# Altium project Controller_board.PrjPcb
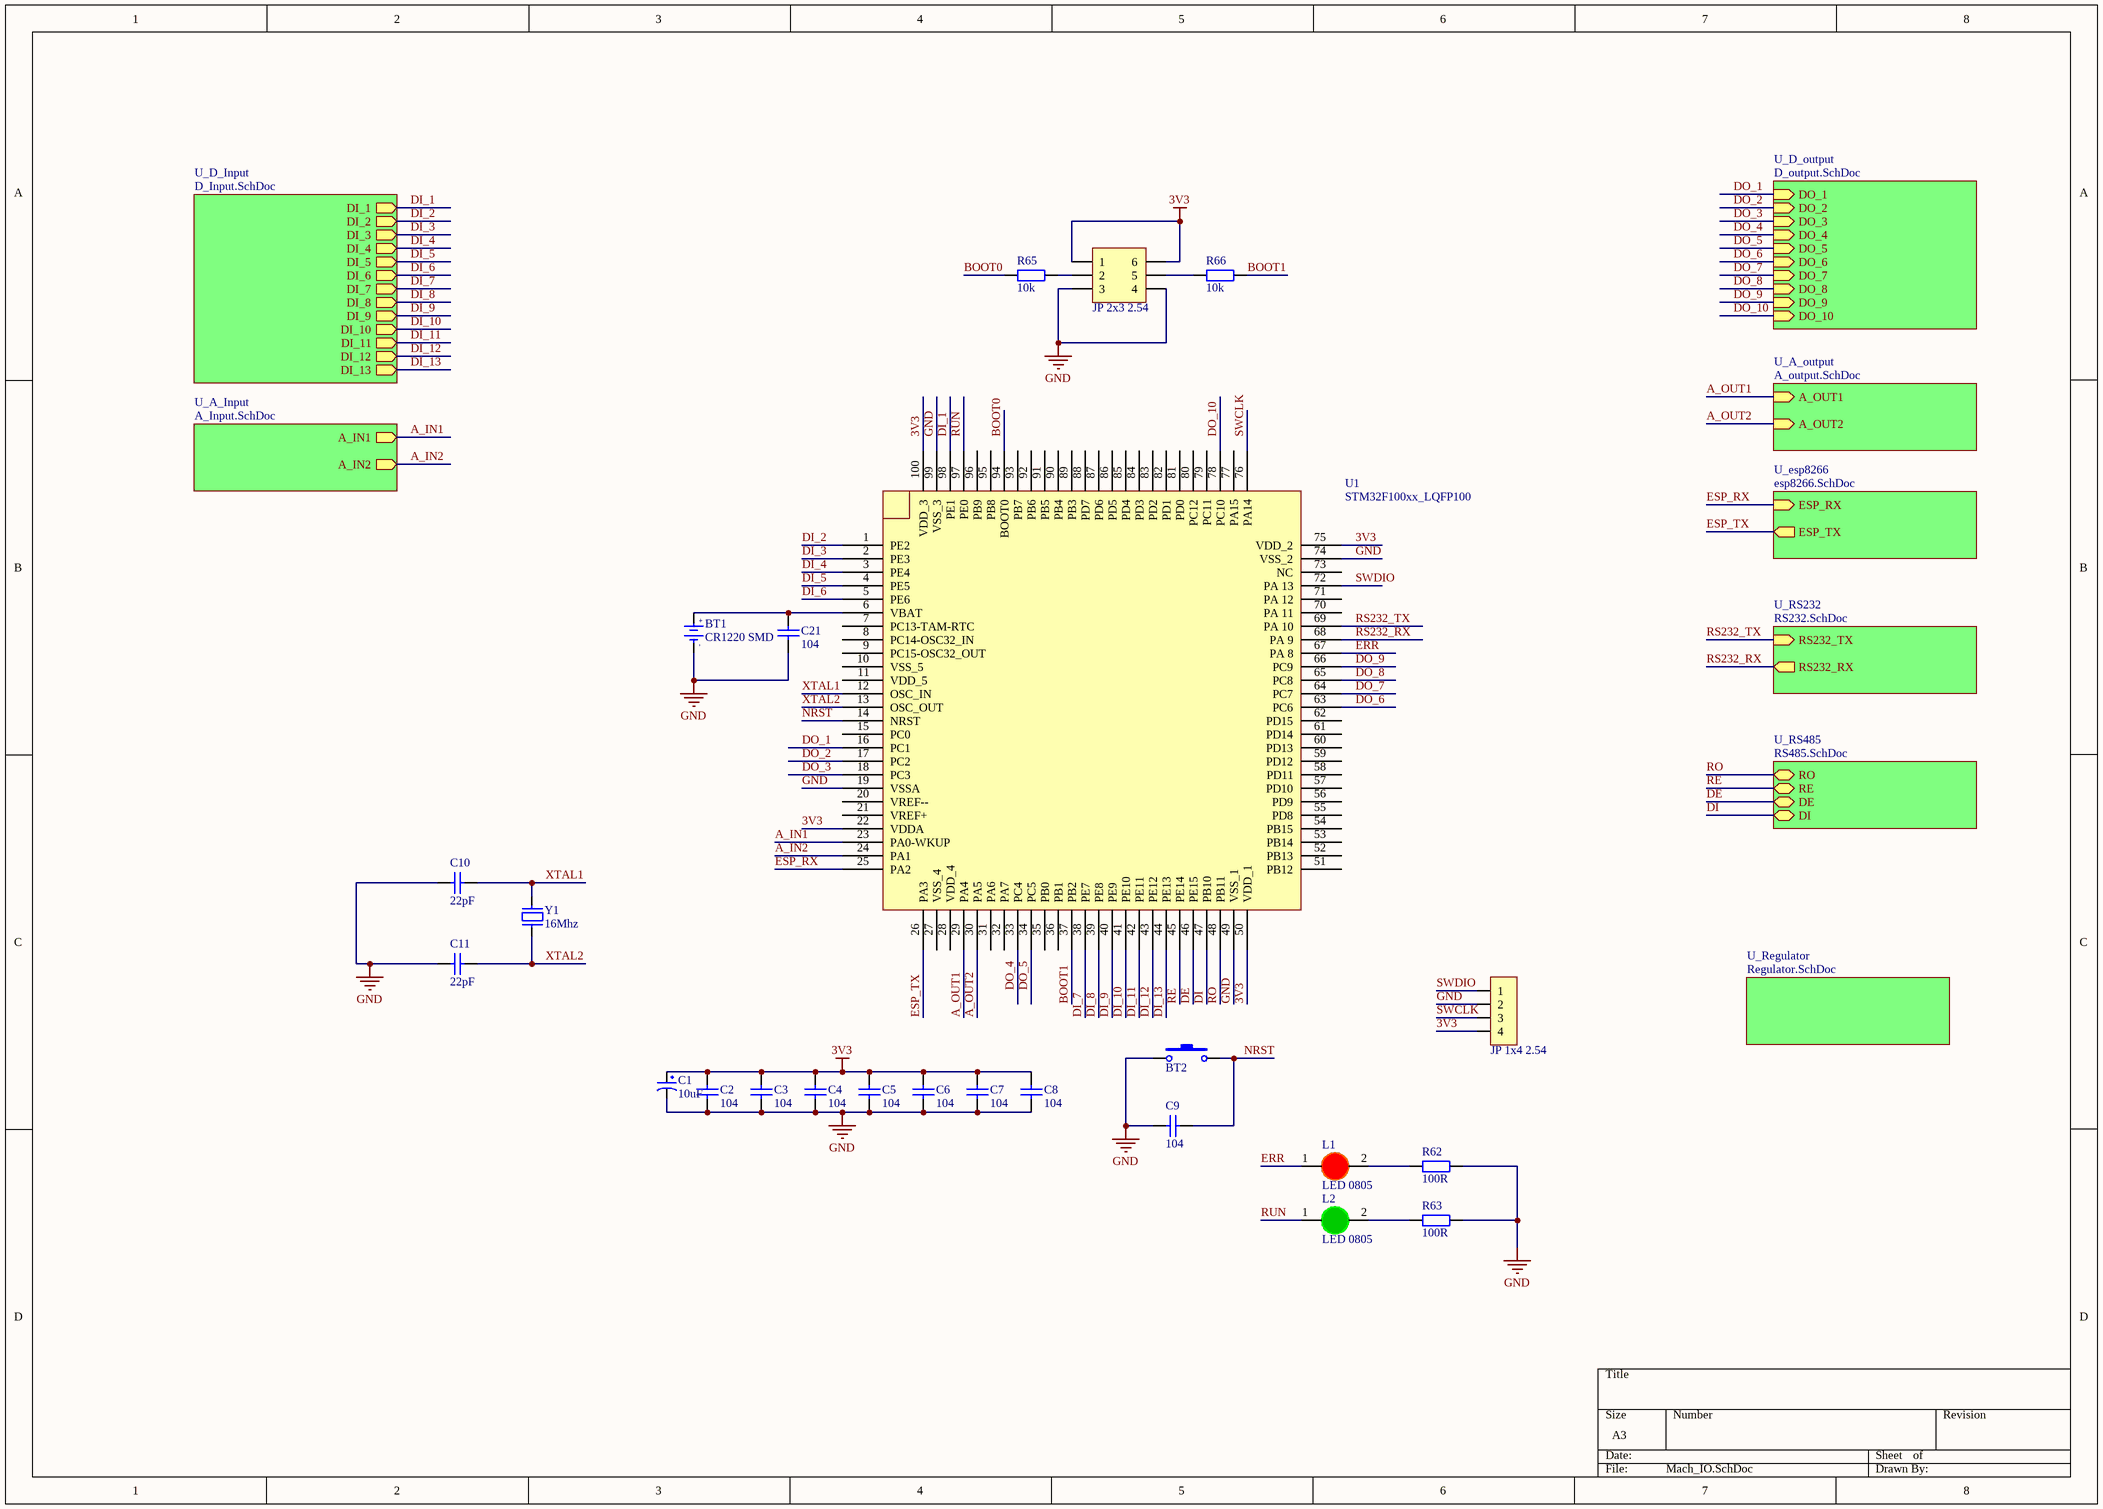
[diagram p0: Mach_IO.SchDoc]
9 sheets, 150 parts. Net scope: hierarchical (ports join the sheet entries above them; power ports are global).
Board file: Mach_IO.PcbDoc
Sheets:
  Mach_IO.SchDoc
    U_D_Input = D_Input.SchDoc
    U_D_output = D_output.SchDoc
    U_RS232 = RS232.SchDoc
    U_RS485 = RS485.SchDoc
    U_esp8266 = esp8266.SchDoc
    U_A_Input = A_Input.SchDoc
    U_A_output = A_output.SchDoc
    U_Regulator = Regulator.SchDoc

## Sheet Mach_IO.SchDoc
size A3; SheetNumber: 1; SheetTotal: 9

### Parts
BT1  CR1220 SMD  [DE PIN CR1220]
BT2  Nut Nhan 2 Chan SMD 3x6x2.5  [Nut Nhan 2 Chan SMD 3x6x2.5]  (value not drawn)
C1  10uF  [tu tantalum smd3216]
C2  104  [tu 0805]
C3  104  [tu 0805]
C4  104  [tu 0805]
C5  104  [tu 0805]
C6  104  [tu 0805]
C7  104  [tu 0805]
C8  104  [tu 0805]
C9  104  [tu 0805]
C10  22pF  [tu 0805]
C11  22pF  [tu 0805]
C21  104  [tu 0805]
JP2  JP 2x3 2.54  [JP 2x3 DT]
JP10  JP 1x4 2.54  [JP 1x4 DT]
L1  LED 0805  [LED-0805-Red]
L2  LED 0805  [LED-0805-Green]
R62  100R  [tro smd 0805]
R63  100R  [tro smd 0805]
R65  10k  [tro smd 0805]
R66  10k  [tro smd 0805]
U1  STM32F100xx_LQFP100  [STM32_LQFP100]
Y1  16Mhz  [Thach Anh 2 chan cam]

### Sub-sheets
U_A_Input = A_Input.SchDoc: A_IN1 (out), A_IN2 (out)
U_A_output = A_output.SchDoc: A_OUT1 (in), A_OUT2 (in)
U_D_Input = D_Input.SchDoc: DI_1 (out), DI_2 (out), DI_3 (out), DI_4 (out), DI_5 (out), DI_6 (out), DI_7 (out), DI_8 (out), DI_9 (out), DI_10 (out), DI_11 (out), DI_12 (out), DI_13 (out)
U_D_output = D_output.SchDoc: DO_1 (in), DO_2 (in), DO_3 (in), DO_4 (in), DO_5 (in), DO_6 (in), DO_7 (in), DO_8 (in), DO_9 (in), DO_10 (in)
U_esp8266 = esp8266.SchDoc: ESP_TX (out), ESP_RX (in)
U_Regulator = Regulator.SchDoc: no entries
U_RS232 = RS232.SchDoc: RS232_RX (out), RS232_TX (in)
U_RS485 = RS485.SchDoc: RO (bidir), RE (bidir), DE (bidir), DI (bidir)

### Nets
3V3: C1.1 C2.1 C3.1 C4.1 C5.1 C6.1 C7.1 C8.1 JP2.1 JP2.6 JP10.4 U1.22(VDDA) U1.50(VDD_1) U1.75(VDD_2) U1.100(VDD_3)
GND: BT1.2(GND) BT2.1 C1.2 C2.2 C3.2 C4.2 C5.2 C6.2 C7.2 C8.2 C9.1 C10.2 C11.2 C21.1 JP2.3 JP2.4 JP10.2 R62.2 R63.2 U1.19(VSSA) U1.49(VSS_1) U1.74(VSS_2) U1.99(VSS_3)
A_IN1: U1.23(PA0-WKUP) ; sheet U_A_Input/A_IN1
A_IN2: U1.24(PA1) ; sheet U_A_Input/A_IN2
A_OUT1: U1.29(PA4) ; sheet U_A_output/A_OUT1
A_OUT2: U1.30(PA5) ; sheet U_A_output/A_OUT2
BOOT0: R65.1 U1.94(BOOT0)
BOOT1: R66.2 U1.37(PB2)
DE: U1.46(PE15) ; sheet U_RS485/DE
DI: U1.47(PB10) ; sheet U_RS485/DI
DI_1: U1.98(PE1) ; sheet U_D_Input/DI_1
DI_2: U1.1(PE2) ; sheet U_D_Input/DI_2
DI_3: U1.2(PE3) ; sheet U_D_Input/DI_3
DI_4: U1.3(PE4) ; sheet U_D_Input/DI_4
DI_5: U1.4(PE5) ; sheet U_D_Input/DI_5
DI_6: U1.5(PE6) ; sheet U_D_Input/DI_6
DI_7: U1.38(PE7) ; sheet U_D_Input/DI_7
DI_8: U1.39(PE8) ; sheet U_D_Input/DI_8
DI_9: U1.40(PE9) ; sheet U_D_Input/DI_9
DI_10: U1.41(PE10) ; sheet U_D_Input/DI_10
DI_11: U1.42(PE11) ; sheet U_D_Input/DI_11
DI_12: U1.43(PE12) ; sheet U_D_Input/DI_12
DI_13: U1.44(PE13) ; sheet U_D_Input/DI_13
DO_1: U1.16(PC1) ; sheet U_D_output/DO_1
DO_2: U1.17(PC2) ; sheet U_D_output/DO_2
DO_3: U1.18(PC3) ; sheet U_D_output/DO_3
DO_4: U1.33(PC4) ; sheet U_D_output/DO_4
DO_5: U1.34(PC5) ; sheet U_D_output/DO_5
DO_6: U1.63(PC6) ; sheet U_D_output/DO_6
DO_7: U1.64(PC7) ; sheet U_D_output/DO_7
DO_8: U1.65(PC8) ; sheet U_D_output/DO_8
DO_9: U1.66(PC9) ; sheet U_D_output/DO_9
DO_10: U1.78(PC10) ; sheet U_D_output/DO_10
ERR: L1.1(A) U1.67(PA_8)
ESP_RX: U1.25(PA2) ; sheet U_esp8266/ESP_RX
ESP_TX: U1.26(PA3) ; sheet U_esp8266/ESP_TX
NRST: BT2.2 C9.2 U1.14(NRST)
RE: U1.45(PE14) ; sheet U_RS485/RE
RO: U1.48(PB11) ; sheet U_RS485/RO
RS232_RX: U1.68(PA_9) ; sheet U_RS232/RS232_RX
RS232_TX: U1.69(PA_10) ; sheet U_RS232/RS232_TX
RUN: L2.1(A) U1.97(PE0)
SWCLK: JP10.3 U1.76(PA14)
SWDIO: JP10.1 U1.72(PA_13)
XTAL1: C10.1 U1.12(OSC_IN) Y1.2
XTAL2: C11.1 U1.13(OSC_OUT) Y1.1
NetBT1_1: BT1.1(+3V) C21.2 U1.6(VBAT)
NetJP2_2: JP2.2 R65.2
NetJP2_5: JP2.5 R66.1
NetL1_2: L1.2(K) R62.1
NetL2_2: L2.2(K) R63.1

Not connected (* = marked no-connect by the designer): U1 7(PC13-TAM-RTC) 8(PC14-OSC32_IN) 9(PC15-OSC32_OUT) 10(VSS_5) 11(VDD_5) 15(PC0) 20(VREF--) 21(VREF+) 27(VSS_4) 28(VDD_4) 31(PA6) 32(PA7) 35(PB0) 36(PB1) 51(PB12) 52(PB13) 53(PB14) 54(PB15) 55(PD8) 56(PD9) 57(PD10) 58(PD11) 59(PD12) 60(PD13) 61(PD14) 62(PD15) 70(PA_11) 71(PA_12) 73(NC) 77(PA15) 79(PC11) 80(PC12) 81(PD0) 82(PD1) 83(PD2) 84(PD3) 85(PD4) 86(PD5) 87(PD6) 88(PD7) 89(PB3) 90(PB4) 91(PB5) 92(PB6) 93(PB7) 95(PB8) 96(PB9)

### Notes on the sheet
- (in symbol De pin CR1220 SMD) +; -

### Library data of the parts
BT1 = De pin CR1220 SMD: Ten: Đế PIN CR1220 SMD; Ma_Hang: MH000833
BT2 = Nut Nhan 2 Chan SMD 3x6x2.5: Ma_Hang: MH001036; Ten: Nút Nhấn 2 Chân 3x6x2.5MM SMD
C1 = Tu tantalum 10uF 16V SMD3216: Dán; Don_Vi: Con; So_Chan: 2; Ten_Linh_Kien: Tụ tantalum 106C-10uF 16V SMD3216; Ma_Hang: MH001954; Chung_Loai: Dán; Kieu_Chan: *
C2-C9 C21 = Tu 0805 104 50V 10%: Dán; Don_Vi: Con; So_Chan: 2; Ten_Linh_Kien: Tụ 0805 104-100nF 10% 50V; Ma_Hang: MH004551; Chung_Loai: Dán; Kieu_Chan: *
C10 C11 = Tu 0805 22pF 50V 10%: Dán; Don_Vi: Con; So_Chan: 2; Ten_Linh_Kien: Tụ 0805 22P 10% 50V; Ma_Hang: MH004560; Chung_Loai: Dán; Kieu_Chan: *
JP2 = JP 2x3 2.54 Duc Thang: Cắm; Ten_Linh_Kien: Jump Đôi Đực 2.54MM 2x40P Thẳng 11MM; Don_Vi: Con; Ma_Hang: MH002686; Ghi_Chu: *; Kieu_Chan: *; Chung_Loai: Cắm
JP10 = JP 1x4 2.54 Duc Thang: Cắm; Ten_Linh_Kien: Jump Đơn Đực 2.54MM 1x40P Thẳng 11MM; Don_Vi: Con; Ma_Hang: MH000903; Ghi_Chu: *; Kieu_Chan: *; Chung_Loai: Cắm
L1 = LED 0805 Do: Dán; Don_Vi: Con; Ma_Hang: MH000897; Ten_Linh_Kien: LED 0805 Màu Đỏ (Red); Ghi_Chu: *; Kieu_Chan: *; Chung_Loai: Dán
L2 = LED 0805 Xanh La: Dán; Don_Vi: Con; Ma_Hang: MH002326; Ten_Linh_Kien: LED 0805 Màu Xanh Lá (Green); Ghi_Chu: *; Kieu_Chan: *; Chung_Loai: Dán
R62 R63 = Tro 0805 5% 100R: Dán; Don_Vi: Con; So_Chan: 2; Ten_Linh_Kien: Trở 0805 5% 100R; Ma_Hang: MH005251; Chung_Loai: Dán; Kieu_Chan: *
R65 R66 = Tro 0805 1% 10k: Dán; Don_Vi: Con; So_Chan: 2; Ten_Linh_Kien: Trở 0805 1% 10k; Ma_Hang: MH005473; Chung_Loai: Dán; Kieu_Chan: *
Y1 = Thach Anh 2 chan Cam: Crystal For all Crystal 2pin.; Value: 4Mhz

## Sheet D_Input.SchDoc
size A; SheetNumber: 2; SheetTotal: 9
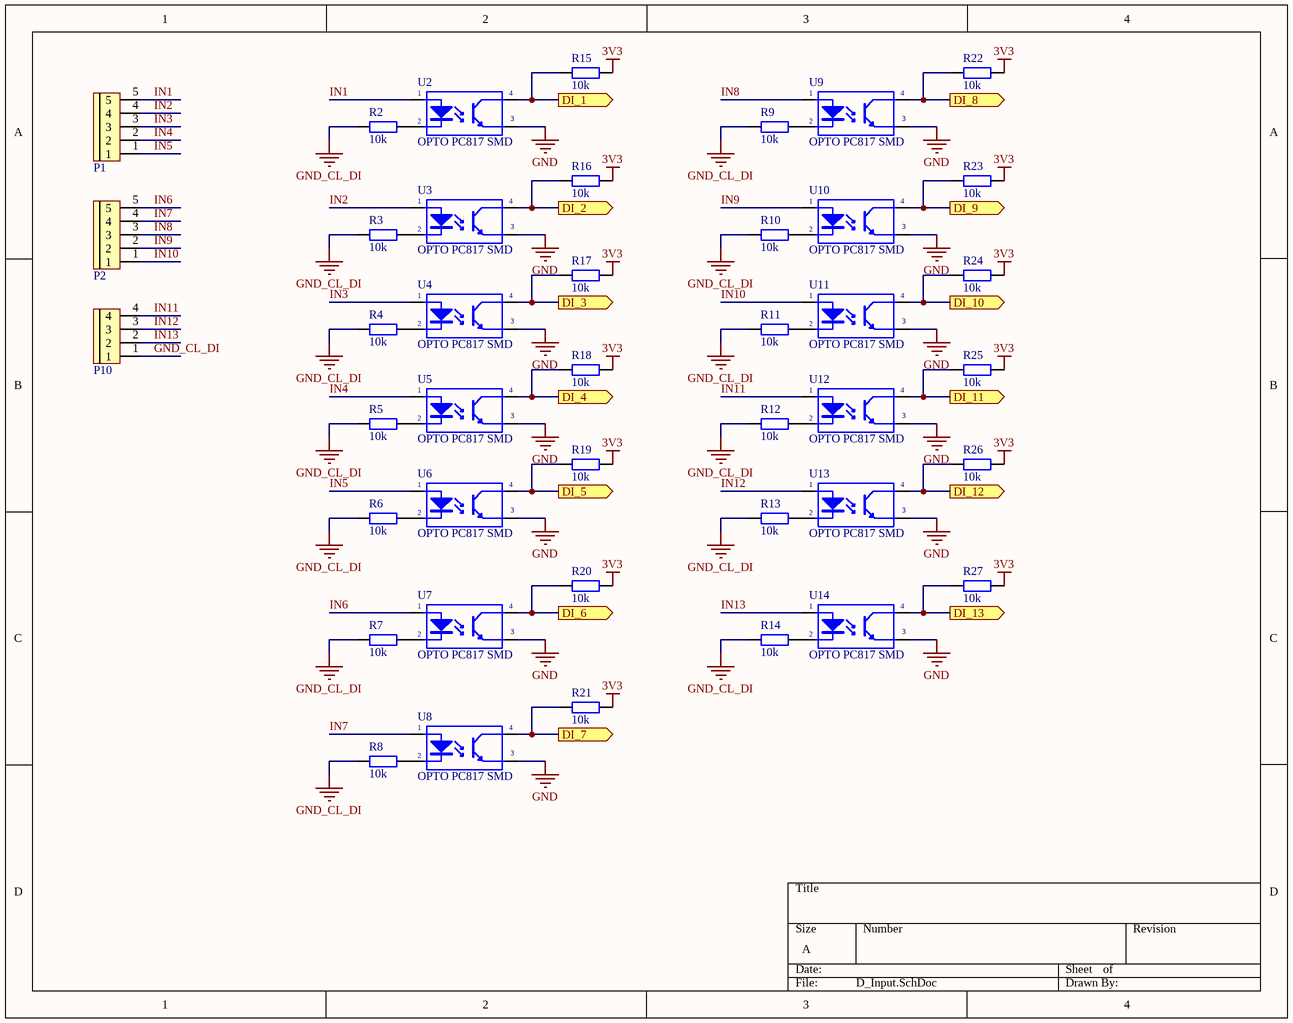
[diagram p1: D_Input.SchDoc]

### Parts
P1  CON 5 EDG5.08  [CON 5 5EDG5.08]  (value not drawn)
P2  CON 5 EDG5.08  [CON 5 5EDG5.08]  (value not drawn)
P10  CON 4 EDG5.08  [CON 4 4EDG5.08]  (value not drawn)
R2  10k  [tro smd 0805]
R3  10k  [tro smd 0805]
R4  10k  [tro smd 0805]
R5  10k  [tro smd 0805]
R6  10k  [tro smd 0805]
R7  10k  [tro smd 0805]
R8  10k  [tro smd 0805]
R9  10k  [tro smd 0805]
R10  10k  [tro smd 0805]
R11  10k  [tro smd 0805]
R12  10k  [tro smd 0805]
R13  10k  [tro smd 0805]
R14  10k  [tro smd 0805]
R15  10k  [tro smd 0805]
R16  10k  [tro smd 0805]
R17  10k  [tro smd 0805]
R18  10k  [tro smd 0805]
R19  10k  [tro smd 0805]
R20  10k  [tro smd 0805]
R21  10k  [tro smd 0805]
R22  10k  [tro smd 0805]
R23  10k  [tro smd 0805]
R24  10k  [tro smd 0805]
R25  10k  [tro smd 0805]
R26  10k  [tro smd 0805]
R27  10k  [tro smd 0805]
U2  OPTO PC817 SMD  [SOP4]
U3  OPTO PC817 SMD  [SOP4]
U4  OPTO PC817 SMD  [SOP4]
U5  OPTO PC817 SMD  [SOP4]
U6  OPTO PC817 SMD  [SOP4]
U7  OPTO PC817 SMD  [SOP4]
U8  OPTO PC817 SMD  [SOP4]
U9  OPTO PC817 SMD  [SOP4]
U10  OPTO PC817 SMD  [SOP4]
U11  OPTO PC817 SMD  [SOP4]
U12  OPTO PC817 SMD  [SOP4]
U13  OPTO PC817 SMD  [SOP4]
U14  OPTO PC817 SMD  [SOP4]

### Ports
DI_1 (out), DI_2 (out), DI_3 (out), DI_4 (out), DI_5 (out), DI_6 (out), DI_7 (out), DI_8 (out), DI_9 (out), DI_10 (out), DI_11 (out), DI_12 (out), DI_13 (out)

### Nets
3V3: R15.2 R16.2 R17.2 R18.2 R19.2 R20.2 R21.2 R22.2 R23.2 R24.2 R25.2 R26.2 R27.2
GND: U2.3(E) U3.3(E) U4.3(E) U5.3(E) U6.3(E) U7.3(E) U8.3(E) U9.3(E) U10.3(E) U11.3(E) U12.3(E) U13.3(E) U14.3(E)
GND_CL_DI: P10.1 R2.2 R3.2 R4.2 R5.2 R6.2 R7.2 R8.2 R9.2 R10.2 R11.2 R12.2 R13.2 R14.2
DI_1: R15.1 U2.4(C) ; port DI_1
DI_2: R16.1 U3.4(C) ; port DI_2
DI_3: R17.1 U4.4(C) ; port DI_3
DI_4: R18.1 U5.4(C) ; port DI_4
DI_5: R19.1 U6.4(C) ; port DI_5
DI_6: R20.1 U7.4(C) ; port DI_6
DI_7: R21.1 U8.4(C) ; port DI_7
DI_8: R22.1 U9.4(C) ; port DI_8
DI_9: R23.1 U10.4(C) ; port DI_9
DI_10: R24.1 U11.4(C) ; port DI_10
DI_11: R25.1 U12.4(C) ; port DI_11
DI_12: R26.1 U13.4(C) ; port DI_12
DI_13: R27.1 U14.4(C) ; port DI_13
IN1: P1.5 U2.1(A)
IN2: P1.4 U3.1(A)
IN3: P1.3 U4.1(A)
IN4: P1.2 U5.1(A)
IN5: P1.1 U6.1(A)
IN6: P2.5 U7.1(A)
IN7: P2.4 U8.1(A)
IN8: P2.3 U9.1(A)
IN9: P2.2 U10.1(A)
IN10: P2.1 U11.1(A)
IN11: P10.4 U12.1(A)
IN12: P10.3 U13.1(A)
IN13: P10.2 U14.1(A)
NetR2_1: R2.1 U2.2(K)
NetR3_1: R3.1 U3.2(K)
NetR4_1: R4.1 U4.2(K)
NetR5_1: R5.1 U5.2(K)
NetR6_1: R6.1 U6.2(K)
NetR7_1: R7.1 U7.2(K)
NetR8_1: R8.1 U8.2(K)
NetR9_1: R9.1 U9.2(K)
NetR10_1: R10.1 U10.2(K)
NetR11_1: R11.1 U11.2(K)
NetR12_1: R12.1 U12.2(K)
NetR13_1: R13.1 U13.2(K)
NetR14_1: R14.1 U14.2(K)

### Library data of the parts
P1 P2 = CON 5 EDG5.08: Cắm; Ten_Linh_Kien: CON 5 2EDG5.08-5P 5.08MM ( Xanh Cong); Ma_Hang: MH003589; Kieu_Chan: *; Don_Vi: Con; Ghi_Chu: *; Chung_Loai: Cắm
P10 = CON 4 EDG5.08: Cắm; Ten_Linh_Kien: CON 4 2EDG5.08-4P 5.08MM ( Xanh Cong); Ma_Hang: MH000979; Don_Vi: Con; Ghi_Chu: *; Kieu_Chan: *; Chung_Loai: Cắm
R2-R27 = Tro 0805 1% 10k: as R65 on sheet Mach_IO; Chung_Loai: Dán; Kieu_Chan: *
U2-U14 = OPTO PC817 SMD: Single Opto; Value: PC817

## Sheet D_output.SchDoc
size A; SheetNumber: 3; SheetTotal: 9
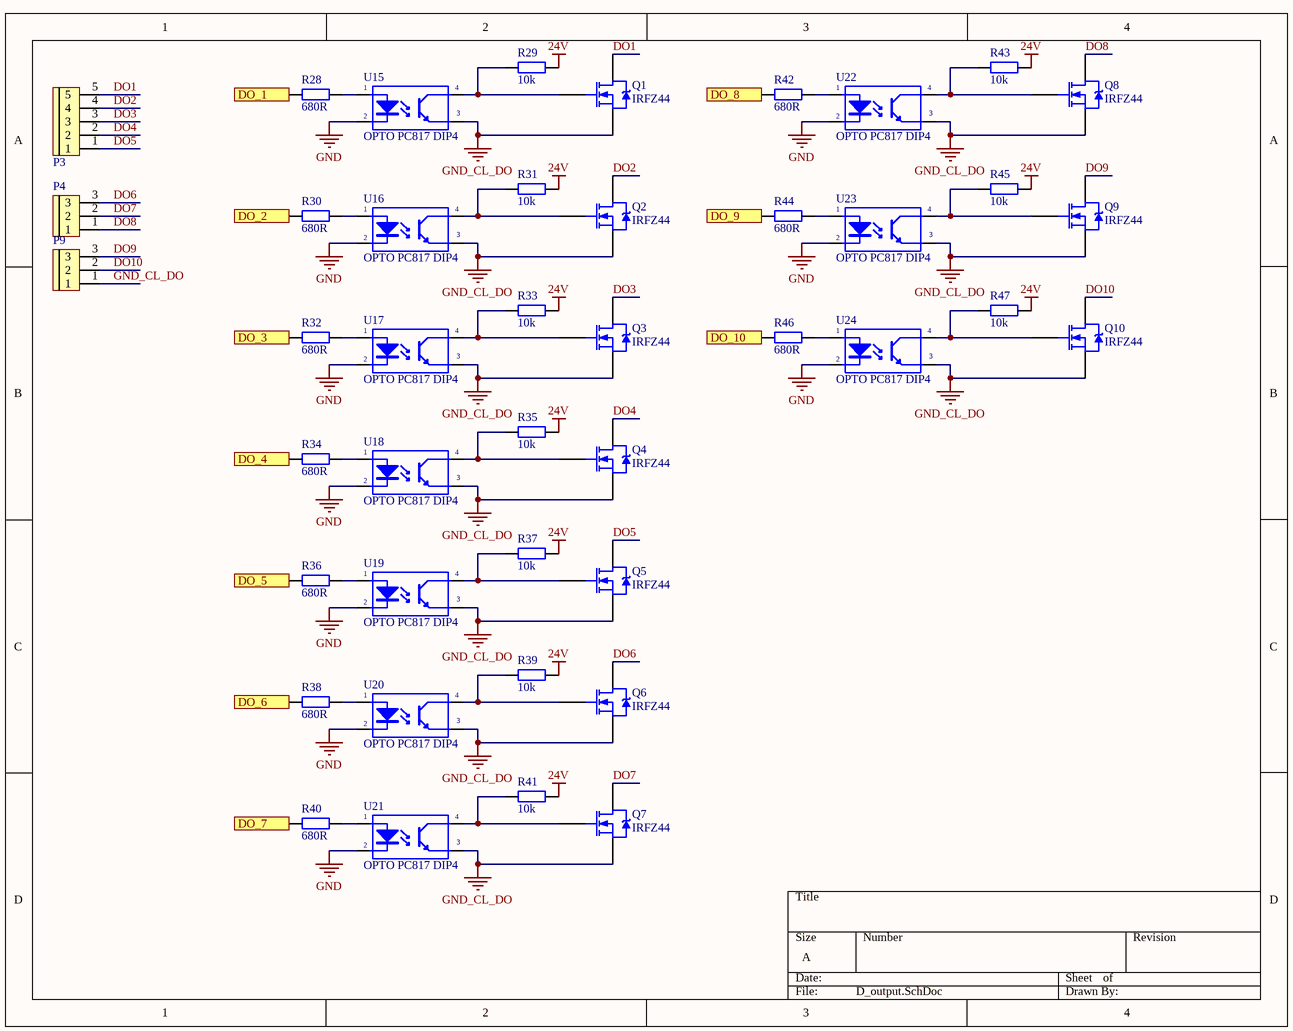
[diagram p2: D_output.SchDoc]

### Parts
P3  CON 5 EDG5.08  [CON 5 5EDG5.08]  (value not drawn)
P4  CON 3 EDG5.08  [CON 3 3EDG5.08]  (value not drawn)
P9  CON 3 EDG5.08  [CON 3 3EDG5.08]  (value not drawn)
Q1  IRFZ44  [TO220]
Q2  IRFZ44  [TO220]
Q3  IRFZ44  [TO220]
Q4  IRFZ44  [TO220]
Q5  IRFZ44  [TO220]
Q6  IRFZ44  [TO220]
Q7  IRFZ44  [TO220]
Q8  IRFZ44  [TO220]
Q9  IRFZ44  [TO220]
Q10  IRFZ44  [TO220]
R28  680R  [tro smd 0805]
R29  10k  [tro smd 0805]
R30  680R  [tro smd 0805]
R31  10k  [tro smd 0805]
R32  680R  [tro smd 0805]
R33  10k  [tro smd 0805]
R34  680R  [tro smd 0805]
R35  10k  [tro smd 0805]
R36  680R  [tro smd 0805]
R37  10k  [tro smd 0805]
R38  680R  [tro smd 0805]
R39  10k  [tro smd 0805]
R40  680R  [tro smd 0805]
R41  10k  [tro smd 0805]
R42  680R  [tro smd 0805]
R43  10k  [tro smd 0805]
R44  680R  [tro smd 0805]
R45  10k  [tro smd 0805]
R46  680R  [tro smd 0805]
R47  10k  [tro smd 0805]
U15  OPTO PC817 DIP4  [DIP4]
U16  OPTO PC817 DIP4  [DIP4]
U17  OPTO PC817 DIP4  [DIP4]
U18  OPTO PC817 DIP4  [DIP4]
U19  OPTO PC817 DIP4  [DIP4]
U20  OPTO PC817 DIP4  [DIP4]
U21  OPTO PC817 DIP4  [DIP4]
U22  OPTO PC817 DIP4  [DIP4]
U23  OPTO PC817 DIP4  [DIP4]
U24  OPTO PC817 DIP4  [DIP4]

### Ports
DO_1 (in), DO_2 (in), DO_3 (in), DO_4 (in), DO_5 (in), DO_6 (in), DO_7 (in), DO_8 (in), DO_9 (in), DO_10 (in)

### Nets
24V: R29.2 R31.2 R33.2 R35.2 R37.2 R39.2 R41.2 R43.2 R45.2 R47.2
GND: U15.2(K) U16.2(K) U17.2(K) U18.2(K) U19.2(K) U20.2(K) U21.2(K) U22.2(K) U23.2(K) U24.2(K)
GND_CL_DO: P9.1 Q1.3(S) Q2.3(S) Q3.3(S) Q4.3(S) Q5.3(S) Q6.3(S) Q7.3(S) Q8.3(S) Q9.3(S) Q10.3(S) U15.3(E) U16.3(E) U17.3(E) U18.3(E) U19.3(E) U20.3(E) U21.3(E) U22.3(E) U23.3(E) U24.3(E)
DO1: P3.5 Q1.2(D)
DO2: P3.4 Q2.2(D)
DO3: P3.3 Q3.2(D)
DO4: P3.2 Q4.2(D)
DO5: P3.1 Q5.2(D)
DO6: P4.3 Q6.2(D)
DO7: P4.2 Q7.2(D)
DO8: P4.1 Q8.2(D)
DO9: P9.3 Q9.2(D)
DO10: P9.2 Q10.2(D)
DO_1: R28.2 ; port DO_1
DO_2: R30.2 ; port DO_2
DO_3: R32.2 ; port DO_3
DO_4: R34.2 ; port DO_4
DO_5: R36.2 ; port DO_5
DO_6: R38.2 ; port DO_6
DO_7: R40.2 ; port DO_7
DO_8: R42.2 ; port DO_8
DO_9: R44.2 ; port DO_9
DO_10: R46.2 ; port DO_10
NetQ1_1: Q1.1(G) R29.1 U15.4(C)
NetQ2_1: Q2.1(G) R31.1 U16.4(C)
NetQ3_1: Q3.1(G) R33.1 U17.4(C)
NetQ4_1: Q4.1(G) R35.1 U18.4(C)
NetQ5_1: Q5.1(G) R37.1 U19.4(C)
NetQ6_1: Q6.1(G) R39.1 U20.4(C)
NetQ7_1: Q7.1(G) R41.1 U21.4(C)
NetQ8_1: Q8.1(G) R43.1 U22.4(C)
NetQ9_1: Q9.1(G) R45.1 U23.4(C)
NetQ10_1: Q10.1(G) R47.1 U24.4(C)
NetR28_1: R28.1 U15.1(A)
NetR30_1: R30.1 U16.1(A)
NetR32_1: R32.1 U17.1(A)
NetR34_1: R34.1 U18.1(A)
NetR36_1: R36.1 U19.1(A)
NetR38_1: R38.1 U20.1(A)
NetR40_1: R40.1 U21.1(A)
NetR42_1: R42.1 U22.1(A)
NetR44_1: R44.1 U23.1(A)
NetR46_1: R46.1 U24.1(A)

### Library data of the parts
P3 = CON 5 EDG5.08: as P1 on sheet D_Input; Kieu_Chan: *; Don_Vi: Con; Ghi_Chu: *; Chung_Loai: Cắm
P4 P9 = CON 3 EDG5.08: Cắm; Ten_Linh_Kien: CON 3 2EDG5.08-3P 5.08MM ( Xanh Cong); Ma_Hang: MH000760; Ghi_Chu: *; Kieu_Chan: *; Don_Vi: Con; Chung_Loai: Cắm
Q1-Q10 = FET IRFZ44 DIP: TO-220
R28-R47 = Tro 0805 1% 10k: as R65 on sheet Mach_IO; Chung_Loai: Dán; Kieu_Chan: *
U15-U24 = OPTO PC817 DIP4: Single Opto; Value: PC817

## Sheet RS232.SchDoc
size A; SheetNumber: 4; SheetTotal: 9
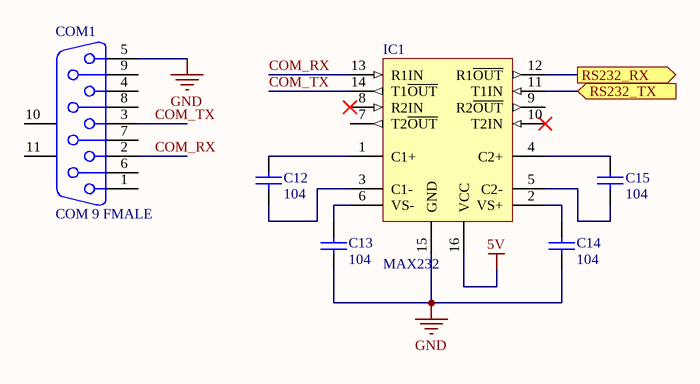
[diagram p3: RS232.SchDoc]

### Parts
C12  104  [tu 0805]
C13  104  [tu 0805]
C14  104  [tu 0805]
C15  104  [tu 0805]
COM1  COM 9 FMALE  [DSB 9-F]
IC1  MAX232  [DIP16/W0.3]

### Ports
RS232_RX (out), RS232_TX (in)

### Nets
5V: IC1.16(VCC)
GND: C13.1 C14.2 COM1.5 IC1.15(GND)
COM_RX: COM1.2 IC1.13(R1IN)
COM_TX: COM1.3 IC1.14(T1~{OUT})
RS232_RX: IC1.12(R1~{OUT}) ; port RS232_RX
RS232_TX: IC1.11(T1IN) ; port RS232_TX
NetC12_1: C12.1 IC1.1(C1+)
NetC12_2: C12.2 IC1.3(C1-)
NetC13_2: C13.2 IC1.6(VS-)
NetC14_1: C14.1 IC1.2(VS+)
NetC15_1: C15.1 IC1.4(C2+)
NetC15_2: C15.2 IC1.5(C2-)

Not connected (* = marked no-connect by the designer): COM1 1 4 6 7 8 9 10(MH1) 11(MH2); IC1 7(T2~{OUT}) 8(R2IN)* 9(R2~{OUT}) 10(T2IN)*

### Library data of the parts
C12-C15 = Tu 0805 104 50V 10%: as C2 on sheet Mach_IO; Chung_Loai: Dán; Kieu_Chan: *
COM1 = DSB9F: COM 9; PackageDocument: O; Positions: 9; Gender: Receptacle; Value: COM 9; Published: 15-Jun-2001; LatestRevisionDate: 17-Jul-2002; LatestRevisionNote: Re-released for DXP Platform.; DatasheetDocument: 1-Sep-1999; PackageReference: 788750; Publisher: Altium Limited; Orientation: Right Angle
IC1 = MAX232: Dual EIA-232 Driver/Receiver; Value: MAX232

## Sheet RS485.SchDoc
size A; SheetNumber: 5; SheetTotal: 9
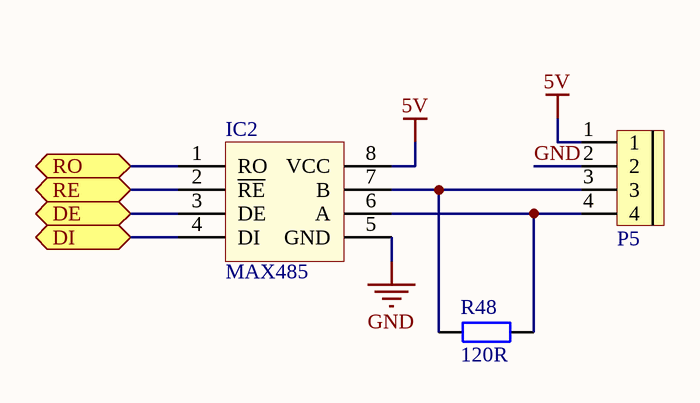
[diagram p4: RS485.SchDoc]

### Parts
IC2  MAX485  [DIP8/W0.3]
P5  CON 4 EDG5.08  [CON 4 4EDG5.08]  (value not drawn)
R48  120R  [tro smd 0805]

### Ports
DE (bidir), DI (bidir), RE (bidir), RO (bidir)

### Nets
5V: IC2.8(VCC) P5.1
GND: IC2.5(GND) P5.2
DE: IC2.3(DE) ; port DE
DI: IC2.4(DI) ; port DI
RE: IC2.2(~{RE}) ; port RE
RO: IC2.1(RO) ; port RO
NetIC2_6: IC2.6(A) P5.4 R48.2
NetIC2_7: IC2.7(B) P5.3 R48.1

### Library data of the parts
IC2 = MAX485: RS232 - RS485 (Same sn75176)
P5 = CON 4 EDG5.08: as P10 on sheet D_Input; Don_Vi: Con; Ghi_Chu: *; Kieu_Chan: *; Chung_Loai: Cắm
R48 = Tro 0805 5% 120R: Dán; Don_Vi: Con; So_Chan: 2; Ten_Linh_Kien: Trở 0805 5% 120R; Ma_Hang: MH005253; Chung_Loai: Dán; Kieu_Chan: *

## Sheet esp8266.SchDoc
size A; SheetNumber: 6; SheetTotal: 9
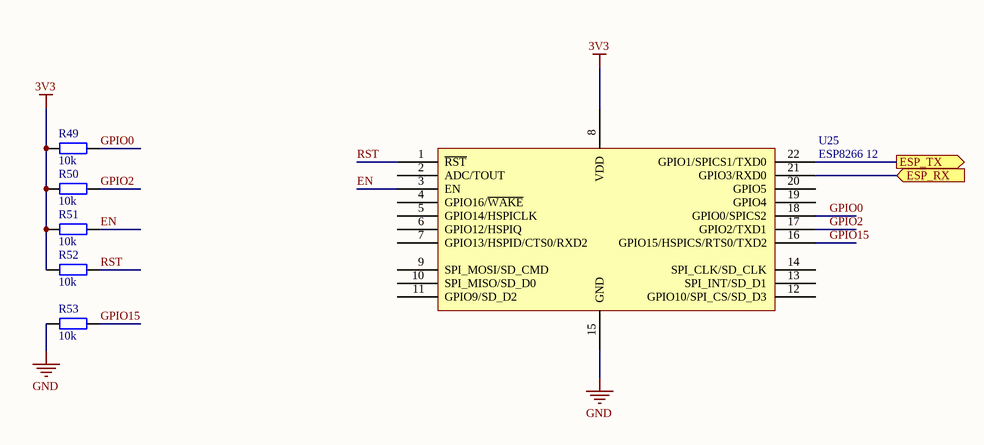
[diagram p5: esp8266.SchDoc]

### Parts
R49  10k  [tro smd 0805]
R50  10k  [tro smd 0805]
R51  10k  [tro smd 0805]
R52  10k  [tro smd 0805]
R53  10k  [tro smd 0805]
U25  ESP8266 12  [ESP8266 12]

### Ports
ESP_RX (in), ESP_TX (out)

### Nets
3V3: R49.1 R50.1 R51.1 R52.1 U25.8(VDD)
GND: R53.1 U25.15(GND)
EN: R51.2 U25.3(EN)
ESP_RX: U25.21(GPIO3/RXD0) ; port ESP_RX
ESP_TX: U25.22(GPIO1/SPICS1/TXD0) ; port ESP_TX
GPIO0: R49.2 U25.18(GPIO0/SPICS2)
GPIO2: R50.2 U25.17(GPIO2/TXD1)
GPIO15: R53.2 U25.16(GPIO15/HSPICS/RTS0/TXD2)
RST: R52.2 U25.1(~{RST})

Not connected (* = marked no-connect by the designer): U25 2(ADC/TOUT) 4(GPIO16/~{WAKE}) 5(GPIO14/HSPICLK) 6(GPIO12/HSPIQ) 7(GPIO13/HSPID/CTS0/RXD2) 9(SPI_MOSI/SD_CMD) 10(SPI_MISO/SD_D0) 11(GPIO9/SD_D2) 12(GPIO10/SPI_CS/SD_D3) 13(SPI_INT/SD_D1) 14(SPI_CLK/SD_CLK) 19(GPIO4) 20(GPIO5)

### Library data of the parts
R49-R53 = Tro 0805 1% 10k: as R65 on sheet Mach_IO; Chung_Loai: Dán; Kieu_Chan: *
U25 = ESP8266 12: ESP8266 12 22 Pin; IC: ESP8266-EX; Vendor: Ai-thinker

## Sheet A_Input.SchDoc
size A; SheetNumber: 7; SheetTotal: 9
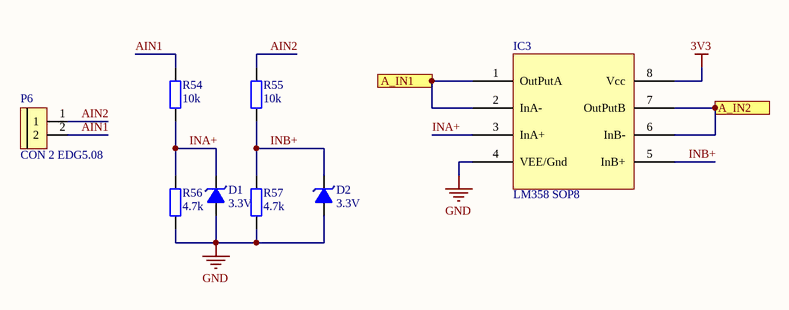
[diagram p6: A_Input.SchDoc]

### Parts
D1  3.3V  [DIODE ZENNER SMD SOD80]
D2  3.3V  [DIODE ZENNER SMD SOD80]
IC3  LM358 SOP8  [SOP 8]
P6  CON 2 EDG5.08  [CON 2 2EDG5.08]
R54  10k  [tro smd 0805]
R55  10k  [tro smd 0805]
R56  4.7k  [tro smd 0805]
R57  4.7k  [tro smd 0805]

### Ports
A_IN1 (out), A_IN2 (out)

### Nets
3V3: IC3.8(Vcc)
GND: D1.1(A) D2.1(A) IC3.4(VEE/Gnd) R56.1 R57.1
A_IN1: IC3.1(OutPutA) IC3.2(InA-) ; port A_IN1
A_IN2: IC3.6(InB-) IC3.7(OutPutB) ; port A_IN2
AIN1: P6.2 R54.2
AIN2: P6.1 R55.2
INA+: D1.2(K) IC3.3(InA+) R54.1 R56.2
INB+: D2.2(K) IC3.5(InB+) R55.1 R57.2

### Library data of the parts
D1 D2 = Diode Zener 3.3V: Dán; Don_Vi: Con; Ma_Hang: MH002880; Ten_Linh_Kien: Diode Zener 1/2W 3.3V SMD1206 ZMM3.3; Kieu_Chan: *; Ghi_Chu: *; Chung_Loai: Dán
IC3 = LM358 SOP8: Dán; Ma_Hang: MH000609; Don_Vi: Con; Ten_Linh_Kien: LM358 SOP8; Kieu_Chan: *; Ghi_Chu: *; Chung_Loai: Dán
P6 = CON 2 EDG5.08: Cắm; Ten_Linh_Kien: CON 2 2EDG5.08-2P 5.08MM ( Xanh Cong); Ma_Hang: MH000759; Ghi_Chu: *; Don_Vi: Con; Kieu_Chan: *; Chung_Loai: Cắm
R54 R55 = Tro 0805 1% 10k: as R65 on sheet Mach_IO; Chung_Loai: Dán; Kieu_Chan: *
R56 R57 = Tro 0805 5% 4.7k: Dán; Don_Vi: Con; So_Chan: 2; Ten_Linh_Kien: Trở 0805 5% 4.7k; Ma_Hang: MH005307; Chung_Loai: Dán; Kieu_Chan: *

## Sheet A_output.SchDoc
size A; SheetNumber: 8; SheetTotal: 9
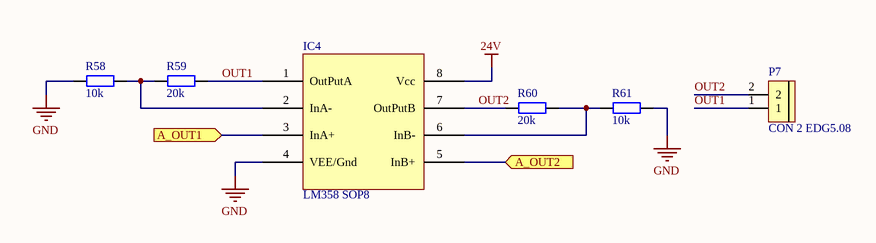
[diagram p7: A_output.SchDoc]

### Parts
IC4  LM358 SOP8  [SOP 8]
P7  CON 2 EDG5.08  [CON 2 2EDG5.08]
R58  10k  [tro smd 0805]
R59  20k  [tro smd 0805]
R60  20k  [tro smd 0805]
R61  10k  [tro smd 0805]

### Ports
A_OUT1 (in), A_OUT2 (in)

### Nets
24V: IC4.8(Vcc)
GND: IC4.4(VEE/Gnd) R58.2 R61.1
A_OUT1: IC4.3(InA+) ; port A_OUT1
A_OUT2: IC4.5(InB+) ; port A_OUT2
OUT1: IC4.1(OutPutA) P7.1 R59.2
OUT2: IC4.7(OutPutB) P7.2 R60.1
NetIC4_2: IC4.2(InA-) R58.1 R59.1
NetIC4_6: IC4.6(InB-) R60.2 R61.2

### Library data of the parts
IC4 = LM358 SOP8: Dán; Ma_Hang: MH000609; Don_Vi: Con; Ten_Linh_Kien: LM358 SOP8; Kieu_Chan: *; Ghi_Chu: *; Chung_Loai: Dán
P7 = CON 2 EDG5.08: as P6 on sheet A_Input; Ghi_Chu: *; Don_Vi: Con; Kieu_Chan: *; Chung_Loai: Cắm
R58 R61 = Tro 0805 1% 10k: as R65 on sheet Mach_IO; Chung_Loai: Dán; Kieu_Chan: *
R59 R60 = Tro 0805 5% 20k: Dán; Don_Vi: Con; So_Chan: 2; Ten_Linh_Kien: Trở 0805 5% 20k; Ma_Hang: MH005247; Chung_Loai: Dán; Kieu_Chan: *

## Sheet Regulator.SchDoc
size A; SheetNumber: 9; SheetTotal: 9
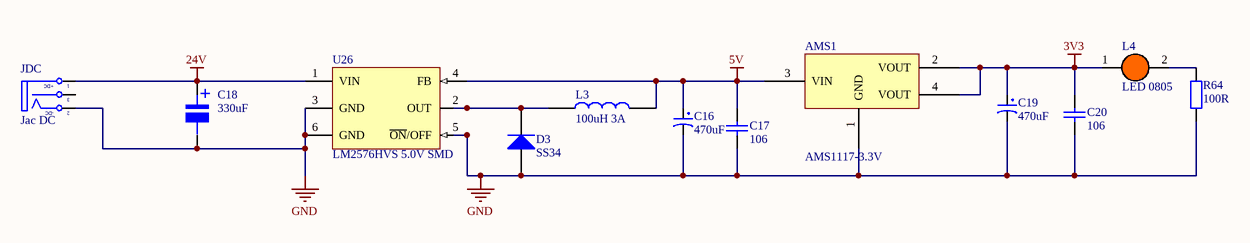
[diagram p8: Regulator.SchDoc]

### Parts
AMS1  AMS1117-3.3V  [SOT223]
C16  470uF  [tu hoa 8mm]
C17  106  [tu 0805]
C18  330uF  [tu nhom 10 (g)]
C19  470uF  [tu hoa 8mm]
C20  106  [tu 0805]
D3  SS34  [DIODE SMA]
JDC  Jac DC  [DC-IN]
L3  100uH 3A  [CUON CAM 100uH3A]
L4  LED 0805  [LED-0805-Orange]
R64  100R  [tro smd 0805]
U26  LM2576HVS 5.0V SMD  [TO263-5]

### Nets
3V3: AMS1.2(VOUT) AMS1.4(VOUT) C19.1 C20.2 L4.1(A)
5V: AMS1.3(VIN) C16.1 C17.2 L3.2 U26.4(FB)
24V: C18.1 JDC.1(T) U26.1(VIN)
GND: AMS1.1(GND) C16.2 C17.1 C18.2 C19.2 C20.1 D3.1(A) JDC.2(TN) R64.2 U26.3(GND) U26.5(~{ON}/OFF) U26.6(GND)
NetD3_2: D3.2(K) L3.1 U26.2(OUT)
NetL4_2: L4.2(K) R64.1

Not connected (* = marked no-connect by the designer): JDC 3(S)

### Notes on the sheet
- (in symbol DCIN) +DC; -DC
- (in symbol Tu Nhom 330uF 35V) +

### Library data of the parts
AMS1 = AMS1117 SMD: Dán; Value: AMS1117-3.3V SOT223; Don_Vi: Con; Ma_Hang: MH000596; Ghi_Chu: *; Kieu_Chan: *; Chung_Loai: Dán
C16 C19 = Tu Hoa 470uF 16V 8x11: Cắm; Don_Vi: Con; So_Chan: 2; Ten_Linh_Kien: Tụ Hóa 470uF 16V 8x11MM; Ma_Hang: MH006550; Chung_Loai: Cắm; Kieu_Chan: *
C17 C20 = Tu 0805 106 16V 10%: Dán; Ten_Linh_Kien: Tụ 0805 106-10uF 10% 16V; So_Chan: 2; Don_Vi: Con; Ma_Hang: MH004553; Chung_Loai: Dán; Kieu_Chan: *
C18 = Tu Nhom 330uF 35V: Dán; Don_Vi: Con; So_Chan: 2; Ten_Linh_Kien: Tụ Nhôm 330uF 35V 10x10.5MM; Ma_Hang: MH004414; Chung_Loai: Dán; Kieu_Chan: *
D3 = Diode SS34 ( 1N5822 ): Dán; Don_Vi: Con; Ma_Hang: MH002104; Ten_Linh_Kien: Diode SS34 3A 40V SMA ( 1N5822 SS34A); Kieu_Chan: *; Chung_Loai: Dán
JDC = DCIN: Jac DC input; Value: Jac DC
L3 = CUON CAM 100uH DIP: Dán; Don_Vi: Con; Ma_Hang: MH002209; Ten_Linh_Kien: Cuộn Cảm 100uH 3A 8x10MM; Chung_Loai: Dán; Ghi Chu: *; Kieu Chan: *
L4 = LED 0805 Cam: Dán; Don_Vi: Con; Ma_Hang: MH002328; Ten_Linh_Kien: LED 0805 Màu Cam ( Orange); Ghi_Chu: *; Kieu_Chan: *; Chung_Loai: Dán
R64 = Tro 0805 5% 100R: as R62 on sheet Mach_IO; Chung_Loai: Dán; Kieu_Chan: *
U26 = LM2576HVS 5.0V SMD: Dán; Ten_Linh_Kien: LM2576HVS-5.0V BUCK 5V 3A TO263-5; Don_Vi: Con; Ma_Hang: MH002362; Ghi_Chu: *; Kieu_Chan: *; Chung_Loai: Dán

## Nets that join several sheets
3V3: Mach_IO (15 pins), D_Input (13 pins), esp8266 (5 pins), A_Input (IC3.8), Regulator (5 pins)
5V: RS232 (IC1.16), RS485 (IC2.8 P5.1), Regulator (5 pins)
24V: D_output (10 pins), A_output (IC4.8), Regulator (C18.1 JDC.1 U26.1)
GND: Mach_IO (23 pins), D_Input (13 pins), D_output (10 pins), RS232 (C13.1 C14.2 COM1.5 IC1.15), RS485 (IC2.5 P5.2), esp8266 (R53.1 U25.15), A_Input (5 pins), A_output (IC4.4 R58.2 R61.1), Regulator (12 pins)
A_IN1: Mach_IO (U1.23), A_Input (IC3.1 IC3.2)
A_IN2: Mach_IO (U1.24), A_Input (IC3.6 IC3.7)
A_OUT1: Mach_IO (U1.29), A_output (IC4.3)
A_OUT2: Mach_IO (U1.30), A_output (IC4.5)
DE: Mach_IO (U1.46), RS485 (IC2.3)
DI: Mach_IO (U1.47), RS485 (IC2.4)
DI_1: Mach_IO (U1.98), D_Input (R15.1 U2.4)
DI_2: Mach_IO (U1.1), D_Input (R16.1 U3.4)
DI_3: Mach_IO (U1.2), D_Input (R17.1 U4.4)
DI_4: Mach_IO (U1.3), D_Input (R18.1 U5.4)
DI_5: Mach_IO (U1.4), D_Input (R19.1 U6.4)
DI_6: Mach_IO (U1.5), D_Input (R20.1 U7.4)
DI_7: Mach_IO (U1.38), D_Input (R21.1 U8.4)
DI_8: Mach_IO (U1.39), D_Input (R22.1 U9.4)
DI_9: Mach_IO (U1.40), D_Input (R23.1 U10.4)
DI_10: Mach_IO (U1.41), D_Input (R24.1 U11.4)
DI_11: Mach_IO (U1.42), D_Input (R25.1 U12.4)
DI_12: Mach_IO (U1.43), D_Input (R26.1 U13.4)
DI_13: Mach_IO (U1.44), D_Input (R27.1 U14.4)
DO_1: Mach_IO (U1.16), D_output (R28.2)
DO_2: Mach_IO (U1.17), D_output (R30.2)
DO_3: Mach_IO (U1.18), D_output (R32.2)
DO_4: Mach_IO (U1.33), D_output (R34.2)
DO_5: Mach_IO (U1.34), D_output (R36.2)
DO_6: Mach_IO (U1.63), D_output (R38.2)
DO_7: Mach_IO (U1.64), D_output (R40.2)
DO_8: Mach_IO (U1.65), D_output (R42.2)
DO_9: Mach_IO (U1.66), D_output (R44.2)
DO_10: Mach_IO (U1.78), D_output (R46.2)
ESP_RX: Mach_IO (U1.25), esp8266 (U25.21)
ESP_TX: Mach_IO (U1.26), esp8266 (U25.22)
RE: Mach_IO (U1.45), RS485 (IC2.2)
RO: Mach_IO (U1.48), RS485 (IC2.1)
RS232_RX: Mach_IO (U1.68), RS232 (IC1.12)
RS232_TX: Mach_IO (U1.69), RS232 (IC1.11)